# Altium schematic sheet HMI Led's_Sheet.SchDoc
size A4; SheetNumber: 3; SheetTotal: 3
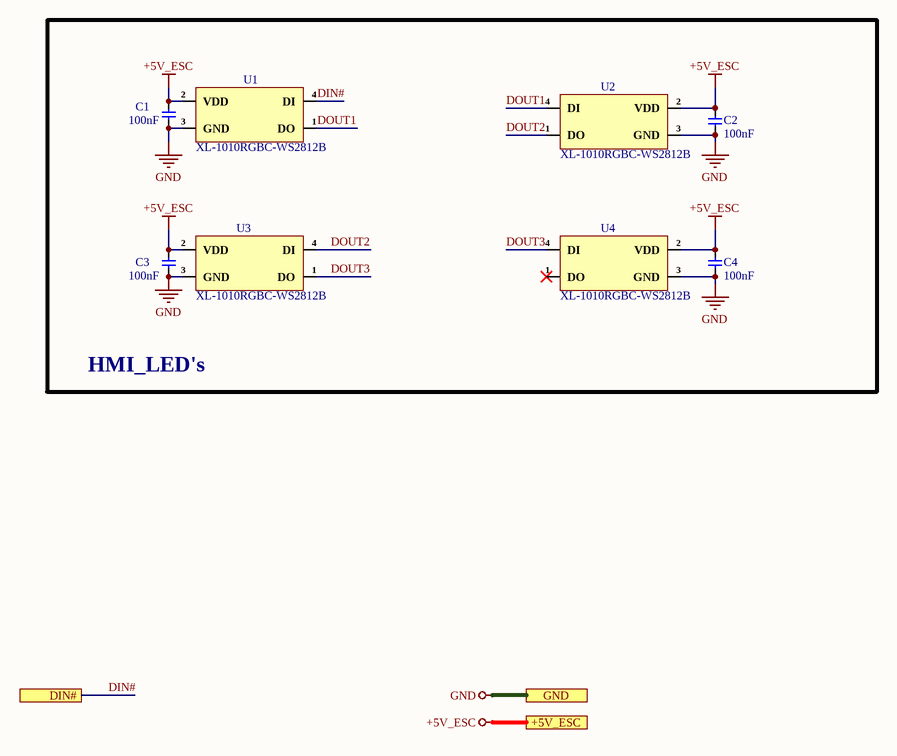
[diagram p0: HMI Led's_Sheet.SchDoc]

## Parts
C1  100nF  [cap-0402]
C2  100nF  [cap-0402]
C3  100nF  [cap-0402]
C4  100nF  [cap-0402]
U1  XL-1010RGBC-WS2812B  [XL-1010RGBC-WS2812B]
U2  XL-1010RGBC-WS2812B  [XL-1010RGBC-WS2812B]
U3  XL-1010RGBC-WS2812B  [XL-1010RGBC-WS2812B]
U4  XL-1010RGBC-WS2812B  [XL-1010RGBC-WS2812B]

## Blocks framed on the sheet
HMI_LED's: C1-C4 U1-U4

## Ports
+5V_ESC (see Top-Sheet[3B], Power_Sheet[3D]), DIN# (see Top-Sheet[3B], Power_Sheet[1D]), GND (see Top-Sheet[3B], Power_Sheet[3D])

## Nets
+5V_ESC: C1.1 C2.1 C3.1 C4.1 U1.2(VDD) U2.2(VDD) U3.2(VDD) U4.2(VDD) ; port +5V_ESC
GND: C1.2 C2.2 C3.2 C4.2 U1.3(GND) U2.3(GND) U3.3(GND) U4.3(GND) ; port GND
DIN#: U1.4(DI) ; port DIN#
DOUT1: U1.1(DO) U2.4(DI)
DOUT2: U2.1(DO) U3.4(DI)
DOUT3: U3.1(DO) U4.4(DI)

Not connected (* = marked no-connect by the designer): U4 1(DO)*

## Notes on the sheet
- File:
- Title:
- Date:
- Page
- Num:
- Total:
- Drawn By: Huzaifa Ali

## Library data of the parts
C1-C4 = C1005X7R1H104KT000F: CAP CER 0.1UF 50V X7R 0402; Manufacturer: TDK; Tolerance: 10%; Voltage: 25V; Item Type: Capacitor; Supplier 1: Avnet; Manufacturer Part Number: C1005X7R1H104KT000F; RoHS: No; Category: Ceramic Capacitors; Dielectric: X7R; Supplier Part Number 1: C1005X7R1H104KT000F; LCSC Part Number: C361198; ComponentLink1Description: LCSC; ComponentLink1URL: https://www.lcsc.com/product-detail/Multilayer-Ceramic-Capacitors-MLCC-SMD-SMT_TDK-C1005X7R1H104KT000F_C361198.html
U1-U4 = XL-1010RGBC-WS2812B: Colorless transparence -40℃~+150℃ 正贴 RGB 120° 1010 Light Emitting Diodes (LED) ROHS; Manufacturer: XINGLIGHT; Item Type: RGB LED; LCSC Part Number: C5349953; Manufacturer Part Number: XL-1010RGBC-WS2812B; Package: 1010; ComponentLink1Description: LCSC; ComponentLink1URL: https://www.lcsc.com/product-detail/span-style-background-color-ff0-RGB-span-LEDs-Built-in-IC_XINGLIGHT-XL-1010RGBC-WS2812B_C5349953.html